# Altium schematic sheet Input_Section.SchDoc
size A4; DocumentNumber: 26; SheetNumber: 26; SheetTotal: 28
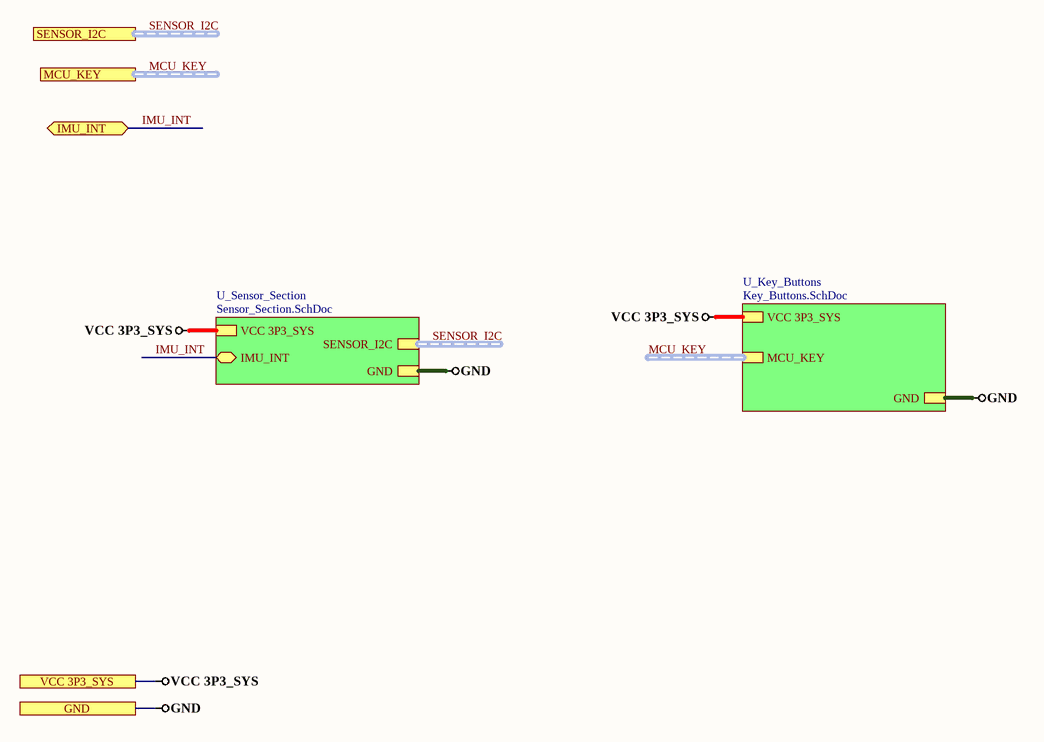
[diagram p0: Input_Section.SchDoc]

## Sub-sheets
U_Key_Buttons = Key_Buttons.SchDoc: MCU_KEY (harness MCU_KEY), VCC 3P3_SYS, GND
U_Sensor_Section = Sensor_Section.SchDoc: VCC 3P3_SYS, GND, SENSOR_I2C (harness SENSOR_I2C), IMU_INT (bidir)

## Ports
GND, IMU_INT (bidir), MCU_KEY (harness MCU_KEY), SENSOR_I2C (harness SENSOR_I2C), VCC 3P3_SYS

## Nets
GND: port GND, sheet U_Sensor_Section/GND, sheet U_Key_Buttons/GND
VCC 3P3_SYS: port VCC 3P3_SYS, sheet U_Sensor_Section/VCC 3P3_SYS, sheet U_Key_Buttons/VCC 3P3_SYS
IMU_INT: port IMU_INT, sheet U_Sensor_Section/IMU_INT

## Buses and harness runs
harness MCU_KEY = port MCU_KEY
harness MCU_KEY = sheet U_Key_Buttons/MCU_KEY
harness SENSOR_I2C = port SENSOR_I2C
harness SENSOR_I2C = sheet U_Sensor_Section/SENSOR_I2C